# Altium schematic sheet N050-8848TSWYG02-H14.schdoc
size 127 x 101 mm
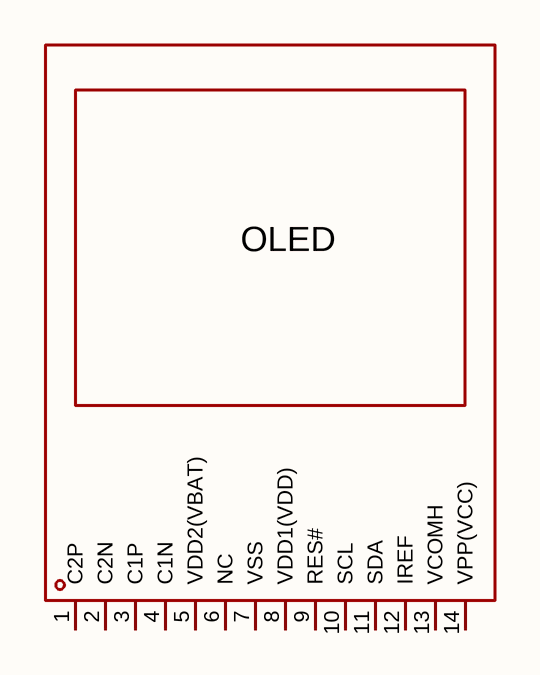
[diagram p0: N050-8848TSWYG02-H14.schdoc]

## Parts
OLED?  n050-8848tswyg02-h14  [OLED-SMD_N050-8848TSWYG02-H14]  (value not drawn)

## Nets

Not connected (* = marked no-connect by the designer): OLED? 1(C2P) 2(C2N) 3(C1P) 4(C1N) 5(VDD2(VBAT)) 6(NC) 7(VSS) 8(VDD1(VDD)) 9(RES#) 10(SCL) 11(SDA) 12(IREF) 13(VCOMH) 14(VPP(VCC))

## Notes on the sheet
- (in symbol n050-8848tswyg02-h14) OLED

## Library data of the parts
OLED? = n050-8848tswyg02-h14: Controller Type:CH1115 chip Size:0.5 Dot Pixels:88x48 Operating Temperature:-40℃~+85℃ Operating Temperature:-40℃~+85℃ Type of Drive:Passive (PMOLED) Display Range:6.124x11.244mm Display Color:White Luminance:100cd/m2; Manufacturer: Wisevision(新智景); AddInBom: yes; ModelId: 012c5d2629a346f097c52c4fa0a6c8e2; ModelTransform: 354.33,677.9514,0,0,0,0,0,-10.827,0; Dot Pixels: 88x48; Display Color: White; Symbol: N050-8848TSWYG02-H14; LCSC Part Name: 0.50寸 白光 88x48像素分辨率 14PIN; SupplierPart: C2890604; ManufacturerPart: N050-8848TSWYG02-H14; Supplier Footprint: -; JLCPCB Part Class: Extended Part; Datasheet: https://item.szlcsc.com/datasheet/N050-8848TSWYG02-H14/3115552.html; Supplier: LCSC; ConvertToPcb: yes; FootprintName: OLED-SMD_N050-8848TSWYG02-H14; ModelName: OLED-SMD_N050-8848TSWYG02-H14; Controller Type: CH1115 chip; Size: 0.5; Operating Temperature: -40℃~+85℃; Type of Drive: Passive (PMOLED); Display Range: 6.124x11.244mm; Luminance: 100cd/m2